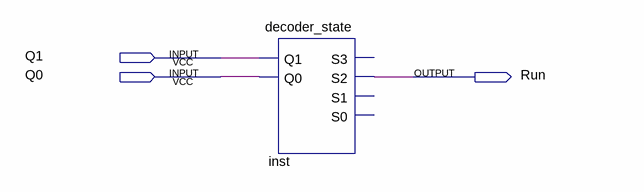
[diagram p0: schematic sheet]
// Quartus schematic Run.bdf as structural Verilog: 1 symbols, 3 pins
module Run (
  input  Q1,
  input  Q0,
  output Run
);

  decoder_state inst (.Q1(Q1), .Q0(Q0), .S2(Run));  // open: S3, S1, S0
endmodule
